# Altium schematic sheet HMS_NiMHCharge.SchDoc
size A
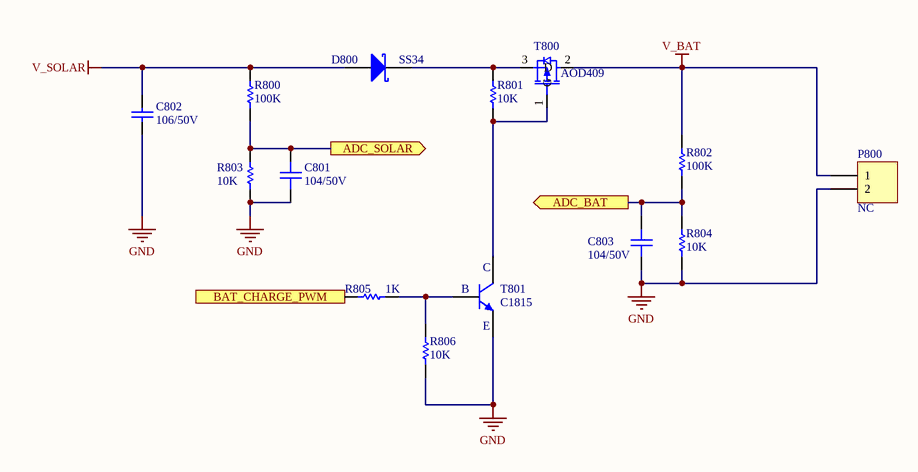
[diagram p0: HMS_NiMHCharge.SchDoc]

## Parts
C801  104/50V  [CAP_CERAMIC_0402(1005)]
C802  106/50V  [CAP_CERAMIC_1206(3216-18)]
C803  104/50V  [CAP_CERAMIC_0402(1005)]
D800  SS34  [DO214AC_SMA_1808]
P800  NC  [H2_BIG]
R800  100K  [RES_0402(1005)]
R801  10K  [RES_0402(1005)]
R802  100K  [RES_0402(1005)]
R803  10K  [RES_0402(1005)]
R804  10K  [RES_0402(1005)]
R805  1K  [RES_0402(1005)]
R806  10K  [RES_0402(1005)]
T800  AOD409  [TO252]
T801  C1815  [SOT23-3]

## Ports
ADC_BAT (out), ADC_SOLAR (out), BAT_CHARGE_PWM (in)

## Nets
GND: C801.1 C802.2 C803.1 P800.2 R803.1 R804.1 R806.1 T801.2
V_BAT: P800.1 R802.2 T800.2(D)
V_SOLAR: C802.1 D800.1(A) R800.2
ADC_BAT: C803.2 R802.1 R804.2 ; port ADC_BAT
ADC_SOLAR: C801.2 R800.1 R803.2 ; port ADC_SOLAR
BAT_CHARGE_PWM: R805.1 ; port BAT_CHARGE_PWM
NetD800_2: D800.2(K) R801.2 T800.3(S)
NetR801_1: R801.1 T800.1(G) T801.3
NetR805_2: R805.2 R806.2 T801.1

## Notes on the sheet
- (in symbol 2SC1815-HF) C; B; E

## Library data of the parts
C801 C803 = Cap Cer 0603 (1608): CAP CER 0.1UF 50V X5R 0402; MPN: CC0402KRX5R9BB104; Published: 8-Jun-2000; LatestRevisionDate: 17-Jul-2002; LatestRevisionNote: Re-released for DXP Platform.; PackageReference: RAD-0.3; Publisher: Altium Limited; Value: 104/50V
C802 = Cap: CAP Ceramic 106/50V 10% 1206; MPN: CL31A106KBHNNNE; Published: 8-Jun-2000; LatestRevisionDate: 17-Jul-2002; LatestRevisionNote: Re-released for DXP Platform.; PackageReference: RAD-0.3; Publisher: Altium Limited; Value: 106/50V
D800 = Diode B340A: Diode Schottky 3A/40V DO-214AB; Published: 8-Jun-2000; LatestRevisionDate: 17-Jul-2002; LatestRevisionNote: Re-released for DXP Platform.; PackageReference: SMB; Publisher: Altium Limited; Code_JEDEC: DO-214-AA; Value: SS34; MPN: SS34
P800 = Header 2: Header, 2-Pin; LatestRevisionDate: 17-Jul-2002; LatestRevisionNote: Re-released for DXP Platform.; Publisher: Altium Limited; Value: NC
R800 R802 = Res1: Resistor 100K 1/8W 1% 0402; MPN: RC0402JR-07100KL; Published: 8-Jun-2000; LatestRevisionDate: 17-Jul-2002; LatestRevisionNote: Re-released for DXP Platform.; PackageReference: AXIAL-0.3; Publisher: Altium Limited; Value: 100K
R801 = Res1: RES 10K OHM 5% 1/8W 0402; Parameter 1: RC0402JR-0710KL; Published: 8-Jun-2000; LatestRevisionDate: 17-Jul-2002; LatestRevisionNote: Re-released for DXP Platform.; PackageReference: AXIAL-0.3; Publisher: Altium Limited; Value: 10K
R803 R804 R806 = Res1: RES 10K OHM 5% 1/8W 0402; MPN: RC0402JR-0710KL; Published: 8-Jun-2000; LatestRevisionDate: 17-Jul-2002; LatestRevisionNote: Re-released for DXP Platform.; PackageReference: AXIAL-0.3; Publisher: Altium Limited; Value: 10K
R805 = Res1: Resistor 1K 1/8W 1% 0603; MPN: RC0402FR-071KL; Published: 8-Jun-2000; LatestRevisionDate: 17-Jul-2002; LatestRevisionNote: Re-released for DXP Platform.; PackageReference: AXIAL-0.3; Publisher: Altium Limited; Value: 1K
T800 = AOD4185: MOSFET P-CH 60V 26A TO252; Manufacturer: International Rectifier; FET Type: MOSFET P-Channel, Metal Oxide; FET Feature: Logic Level Gate; Drain to Source Voltage (Vdss): 20V; Current - Continuous Drain (Id) @ 25° C: 3.7A (Ta); Rds On (Max) @ Id, Vgs: 65 mOhm @ 3.7A, 4.5V; Vgs(th) (Max) @ Id: 1.2V @ 250µA; Gate Charge (Qg) @ Vgs: 12nC @ 5V; Input Capacitance (Ciss) @ Vds: 633pF @ 10V; Power - Max: 1.3W; Supplier 1: Digi-Key; RoHS: RoHS Compliant; Category: Discrete Semiconductor Products; Stock 1: 4068; Pricing 1: 1=0.6, 10=0.34, 25=0.2932, 50=0.2468, 100=0.2209, 250=0.20072, 500=0.18058, 1000=0.16904 (USD); Packaging: Digi-Reel®; Mounting Type: Surface Mount; Package / Case: TO-236-3, SC-59, SOT-23-3; Supplier Device Package: Micro3™/SOT-23; ComponentLink1URL: http://www.irf.com/product-info/datasheets/data/irlml6402gpbf.pdf; ComponentLink1Description: http://www.irf.com/product-info/datasheets/data/irlml6402gpbf.pdf; Supplier Part Number 1: IRLML6402GTRPBFDKR-ND; Value: AOD409; MPN: AOD409
T801 = 2SC1815-HF: Transistor  50V 150mA  NPN SMD SOT-23; Value: C1815; MPN: 2SC1815